# Altium schematic sheet 00.STC16F40K128.SchDoc: 00.STC16F40K128_Diagram
size A4; Organization: Altium Limited; Address1: L3, 12a Rodborough Rd; Address2: Frenchs Forest; Address3: NSW; Address4: Australia 2086; Revision: V1; SheetNumber: 1; SheetTotal: 6; Project: STC16F40K128
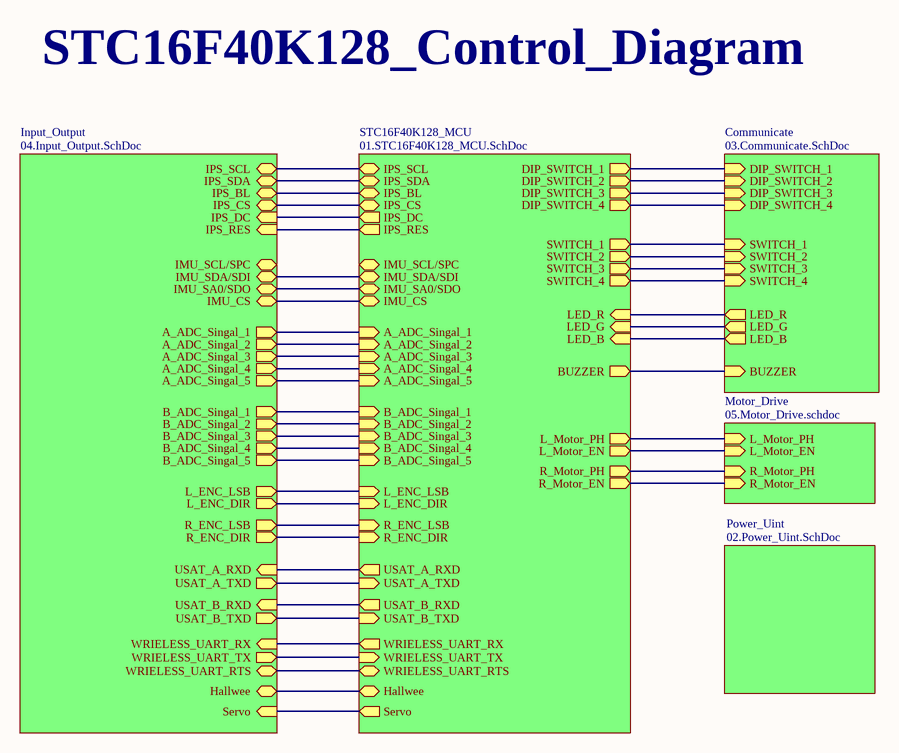
[diagram p0: 00.STC16F40K128.SchDoc]

## Sub-sheets
Communicate = 03.Communicate.SchDoc: DIP_SWITCH_3 (in), DIP_SWITCH_4 (in), DIP_SWITCH_1 (in), DIP_SWITCH_2 (in), SWITCH_3 (in), SWITCH_4 (in), SWITCH_1 (in), SWITCH_2 (in), LED_R (out), LED_G (out), LED_B (out), BUZZER (in)
Input_Output = 04.Input_Output.SchDoc: IMU_SCL/SPC (bidir), IMU_SDA/SDI (bidir), IMU_SA0/SDO (bidir), IMU_CS (bidir), L_ENC_DIR (out), R_ENC_DIR (out), R_ENC_LSB (out), L_ENC_LSB (out), USAT_A_RXD (in), USAT_A_TXD (out), USAT_B_RXD (in), USAT_B_TXD (out), WRIELESS_UART_RX (in), WRIELESS_UART_TX (out), WRIELESS_UART_RTS (bidir), Hallwee (bidir), Servo (in), IPS_SCL (bidir), IPS_RES (in), IPS_SDA (bidir), IPS_CS (bidir), IPS_BL (bidir), IPS_DC (in), B_ADC_Singal_1 (out), B_ADC_Singal_2 (out), B_ADC_Singal_3 (out), B_ADC_Singal_4 (out), B_ADC_Singal_5 (out), A_ADC_Singal_1 (out), A_ADC_Singal_2 (out), A_ADC_Singal_3 (out), A_ADC_Singal_4 (out), A_ADC_Singal_5 (out)
Motor_Drive = 05.Motor_Drive.schdoc: L_Motor_PH (in), L_Motor_EN (in), R_Motor_PH (in), R_Motor_EN (in)
Power_Uint = 02.Power_Uint.SchDoc: no entries
STC16F40K128_MCU = 01.STC16F40K128_MCU.SchDoc: IMU_SCL/SPC (bidir), IMU_SDA/SDI (bidir), IMU_SA0/SDO (bidir), IMU_CS (bidir), L_ENC_LSB (in), L_ENC_DIR (in), R_ENC_LSB (in), R_ENC_DIR (in), DIP_SWITCH_1 (out), DIP_SWITCH_2 (out), DIP_SWITCH_3 (out), DIP_SWITCH_4 (out), SWITCH_1 (out), SWITCH_2 (out), SWITCH_3 (out), SWITCH_4 (out), LED_R (in), LED_G (in), LED_B (in), BUZZER (out), L_Motor_PH (out), L_Motor_EN (out), R_Motor_PH (out), R_Motor_EN (out), USAT_A_TXD (in), USAT_A_RXD (out), USAT_B_TXD (in), USAT_B_RXD (out), WRIELESS_UART_TX (in), WRIELESS_UART_RX (out), WRIELESS_UART_RTS (bidir), Hallwee (bidir), Servo (out), IPS_SCL (bidir), IPS_RES (out), IPS_SDA (bidir), IPS_CS (bidir), IPS_BL (bidir), IPS_DC (out), A_ADC_Singal_1 (in), A_ADC_Singal_2 (in), A_ADC_Singal_3 (in), A_ADC_Singal_4 (in), A_ADC_Singal_5 (in), B_ADC_Singal_1 (in), B_ADC_Singal_2 (in), B_ADC_Singal_3 (in), B_ADC_Singal_4 (in), B_ADC_Singal_5 (in)

## Nets
(unnamed): sheet STC16F40K128_MCU/IMU_SDA/SDI, sheet Input_Output/IMU_SDA/SDI
(unnamed): sheet STC16F40K128_MCU/IMU_SA0/SDO, sheet Input_Output/IMU_SA0/SDO
(unnamed): sheet STC16F40K128_MCU/IMU_CS, sheet Input_Output/IMU_CS
(unnamed): sheet STC16F40K128_MCU/L_ENC_LSB, sheet Input_Output/L_ENC_LSB
(unnamed): sheet STC16F40K128_MCU/L_ENC_DIR, sheet Input_Output/L_ENC_DIR
(unnamed): sheet STC16F40K128_MCU/R_ENC_LSB, sheet Input_Output/R_ENC_LSB
(unnamed): sheet STC16F40K128_MCU/R_ENC_DIR, sheet Input_Output/R_ENC_DIR
(unnamed): sheet STC16F40K128_MCU/DIP_SWITCH_1, sheet Communicate/DIP_SWITCH_1
(unnamed): sheet STC16F40K128_MCU/DIP_SWITCH_2, sheet Communicate/DIP_SWITCH_2
(unnamed): sheet STC16F40K128_MCU/DIP_SWITCH_3, sheet Communicate/DIP_SWITCH_3
(unnamed): sheet STC16F40K128_MCU/DIP_SWITCH_4, sheet Communicate/DIP_SWITCH_4
(unnamed): sheet STC16F40K128_MCU/SWITCH_1, sheet Communicate/SWITCH_1
(unnamed): sheet STC16F40K128_MCU/SWITCH_2, sheet Communicate/SWITCH_2
(unnamed): sheet STC16F40K128_MCU/SWITCH_3, sheet Communicate/SWITCH_3
(unnamed): sheet STC16F40K128_MCU/SWITCH_4, sheet Communicate/SWITCH_4
(unnamed): sheet STC16F40K128_MCU/LED_R, sheet Communicate/LED_R
(unnamed): sheet STC16F40K128_MCU/LED_G, sheet Communicate/LED_G
(unnamed): sheet STC16F40K128_MCU/LED_B, sheet Communicate/LED_B
(unnamed): sheet STC16F40K128_MCU/BUZZER, sheet Communicate/BUZZER
(unnamed): sheet STC16F40K128_MCU/L_Motor_PH, sheet Motor_Drive/L_Motor_PH
(unnamed): sheet STC16F40K128_MCU/L_Motor_EN, sheet Motor_Drive/L_Motor_EN
(unnamed): sheet STC16F40K128_MCU/R_Motor_PH, sheet Motor_Drive/R_Motor_PH
(unnamed): sheet STC16F40K128_MCU/R_Motor_EN, sheet Motor_Drive/R_Motor_EN
(unnamed): sheet STC16F40K128_MCU/USAT_A_TXD, sheet Input_Output/USAT_A_TXD
(unnamed): sheet STC16F40K128_MCU/USAT_A_RXD, sheet Input_Output/USAT_A_RXD
(unnamed): sheet STC16F40K128_MCU/USAT_B_TXD, sheet Input_Output/USAT_B_TXD
(unnamed): sheet STC16F40K128_MCU/USAT_B_RXD, sheet Input_Output/USAT_B_RXD
(unnamed): sheet STC16F40K128_MCU/WRIELESS_UART_TX, sheet Input_Output/WRIELESS_UART_TX
(unnamed): sheet STC16F40K128_MCU/WRIELESS_UART_RX, sheet Input_Output/WRIELESS_UART_RX
(unnamed): sheet STC16F40K128_MCU/WRIELESS_UART_RTS, sheet Input_Output/WRIELESS_UART_RTS
(unnamed): sheet STC16F40K128_MCU/Hallwee, sheet Input_Output/Hallwee
(unnamed): sheet STC16F40K128_MCU/Servo, sheet Input_Output/Servo
(unnamed): sheet STC16F40K128_MCU/IPS_SCL, sheet Input_Output/IPS_SCL
(unnamed): sheet STC16F40K128_MCU/IPS_RES, sheet Input_Output/IPS_RES
(unnamed): sheet STC16F40K128_MCU/IPS_SDA, sheet Input_Output/IPS_SDA
(unnamed): sheet STC16F40K128_MCU/IPS_CS, sheet Input_Output/IPS_CS
(unnamed): sheet STC16F40K128_MCU/IPS_BL, sheet Input_Output/IPS_BL
(unnamed): sheet STC16F40K128_MCU/IPS_DC, sheet Input_Output/IPS_DC
(unnamed): sheet STC16F40K128_MCU/A_ADC_Singal_1, sheet Input_Output/A_ADC_Singal_1
(unnamed): sheet STC16F40K128_MCU/A_ADC_Singal_2, sheet Input_Output/A_ADC_Singal_2
(unnamed): sheet STC16F40K128_MCU/A_ADC_Singal_3, sheet Input_Output/A_ADC_Singal_3
(unnamed): sheet STC16F40K128_MCU/A_ADC_Singal_4, sheet Input_Output/A_ADC_Singal_4
(unnamed): sheet STC16F40K128_MCU/A_ADC_Singal_5, sheet Input_Output/A_ADC_Singal_5
(unnamed): sheet STC16F40K128_MCU/B_ADC_Singal_1, sheet Input_Output/B_ADC_Singal_1
(unnamed): sheet STC16F40K128_MCU/B_ADC_Singal_2, sheet Input_Output/B_ADC_Singal_2
(unnamed): sheet STC16F40K128_MCU/B_ADC_Singal_3, sheet Input_Output/B_ADC_Singal_3
(unnamed): sheet STC16F40K128_MCU/B_ADC_Singal_4, sheet Input_Output/B_ADC_Singal_4
(unnamed): sheet STC16F40K128_MCU/B_ADC_Singal_5, sheet Input_Output/B_ADC_Singal_5

## Notes on the sheet
- STC16F40K128_Control_Diagram
- Title：
- Size:
- Project：
- A4
- Date:
- Revision:
- Author：
- Haibara
- Sheet:
- of: